# EAGLE design demo (EAGLE 9.6.2)

## Sheet 1 of 2: Power input
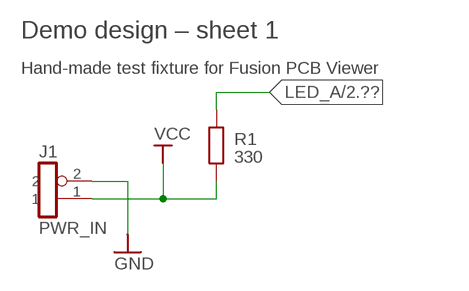
[diagram p0: schematic, sheet 1]

### Parts
J1  PWR_IN  CONN2  [HDR2]
R1  330  R0603  [R0603]

### Nets
GND: J1.2 ; also sheet 2
LED_A: R1.2 ; also sheet 2
VCC: J1.1 R1.1

### Notes on the sheet
- Demo design – sheet 1
- Hand-made test fixture for Fusion PCB Viewer

## Sheet 2 of 2: LED
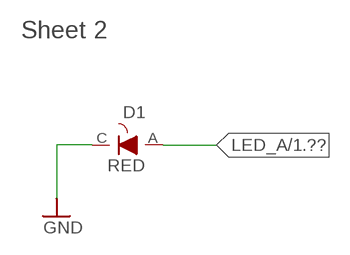
[diagram p1: schematic, sheet 2]

### Parts
D1  RED  LED0603  [LED0603]

### Nets
GND: D1.C ; also sheet 1
LED_A: D1.A ; also sheet 1

### Notes on the sheet
- Sheet 2

## Library data of the parts
D1 = demo:LED
J1 = demo:CONN2
R1 = demo:R: Resistor; MPN: RC0603FR-07330RL

## Board
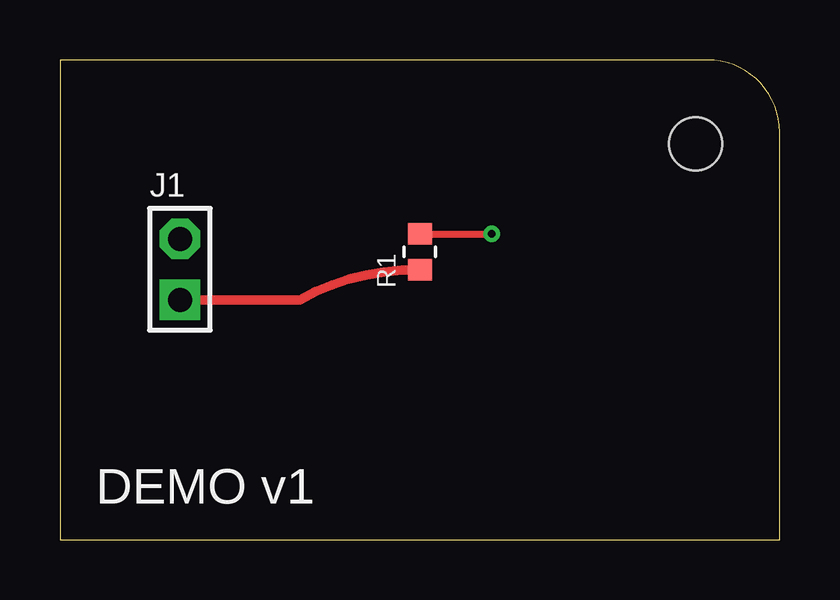
[diagram p2: board, top side]
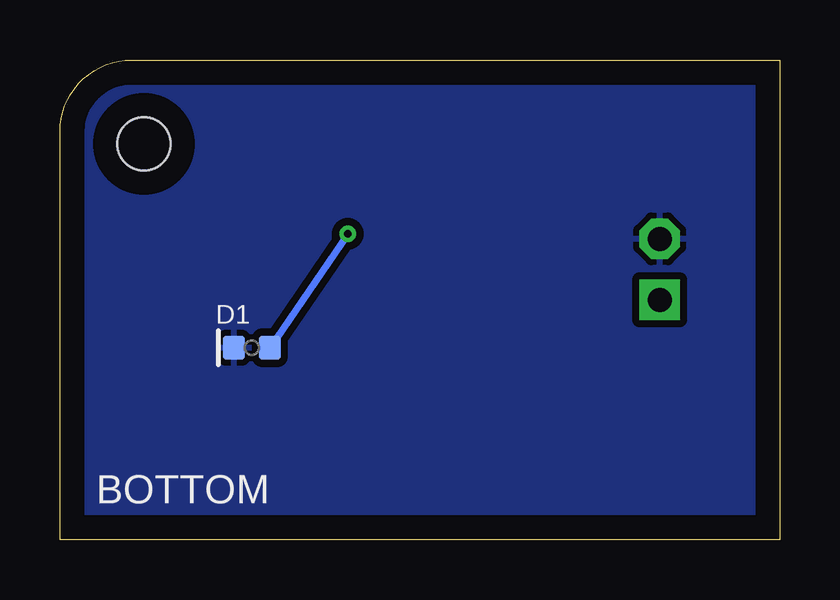
[diagram p3: board, bottom side, seen from below]

Size 30 x 20 mm. Coordinates in mm from the lower left corner, seen from the top.
Outline: 0,0 30,0 30,17 arc90 27,20 0,20 0,0
Copper layers (1*16): Top / Bottom
Design rules "default": track to track 8mil, minimum pad ring 10mil
Holes 2.2 mm at 26.5,16.5

### Footprints (pad centres in the part's own frame; a part is rotated, then mirrored left to right if it is on the bottom)
LED0603 = smd 0.9 x 1: A 0.75,0; C -0.75,0
HDR2 = drill 1 pad 1.7 square: 1 0,0 | drill 1 pad 1.7 octagon: 2 0,2.54
R0603 = smd 0.9 x 1: 1 -0.75,0; 2 0.75,0

### Placement (x,y rotation side)
D1  22,8 0 bottom
J1  5,10 0 top
R1  15,12 90 top

### Tracks (layer width: path | path; a pad name or v marks a point on that pad's centre or on a via)
GND
  pour Bottom (isolate 0.3): 0.5,0.5 29.5,0.5 29.5,19.5 0.5,19.5
LED_A  (via drill 0.3 pad 0.6)
  Top 0.3: R1.2 v18,12.75
  Bottom 0.3: v18,12.75 D1.A
VCC
  Top 0.4: J1.1 10,10 arc-30 R1.1

### Text on the board
tPlace: DEMO v1
bPlace: BOTTOM